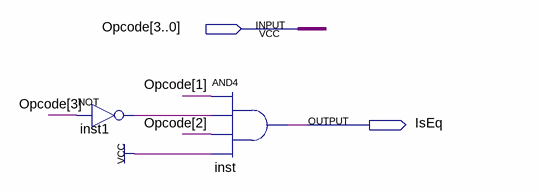
[diagram p0: schematic sheet]
// Quartus schematic IsEq.bdf as structural Verilog: 2 symbols, 2 pins
module IsEq (
  input  [3:0] Opcode,
  output IsEq
);

  wire inst1_out;

  not inst1 (inst1_out, Opcode[3]);
  and inst (IsEq, Opcode[1], inst1_out, Opcode[2], 1'b1);
endmodule
